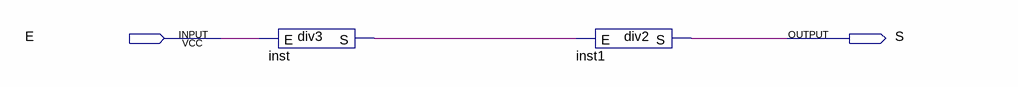
[diagram p0: schematic sheet]
// Quartus schematic Div6.bdf as structural Verilog: 2 symbols, 2 pins
module Div6 (
  input  E,
  output S
);

  wire inst_s;

  div3 inst (.E(E), .S(inst_s));
  div2 inst1 (.E(inst_s), .S(S));
endmodule
